# Altium schematic sheet OPA4377.SchDoc
size A2
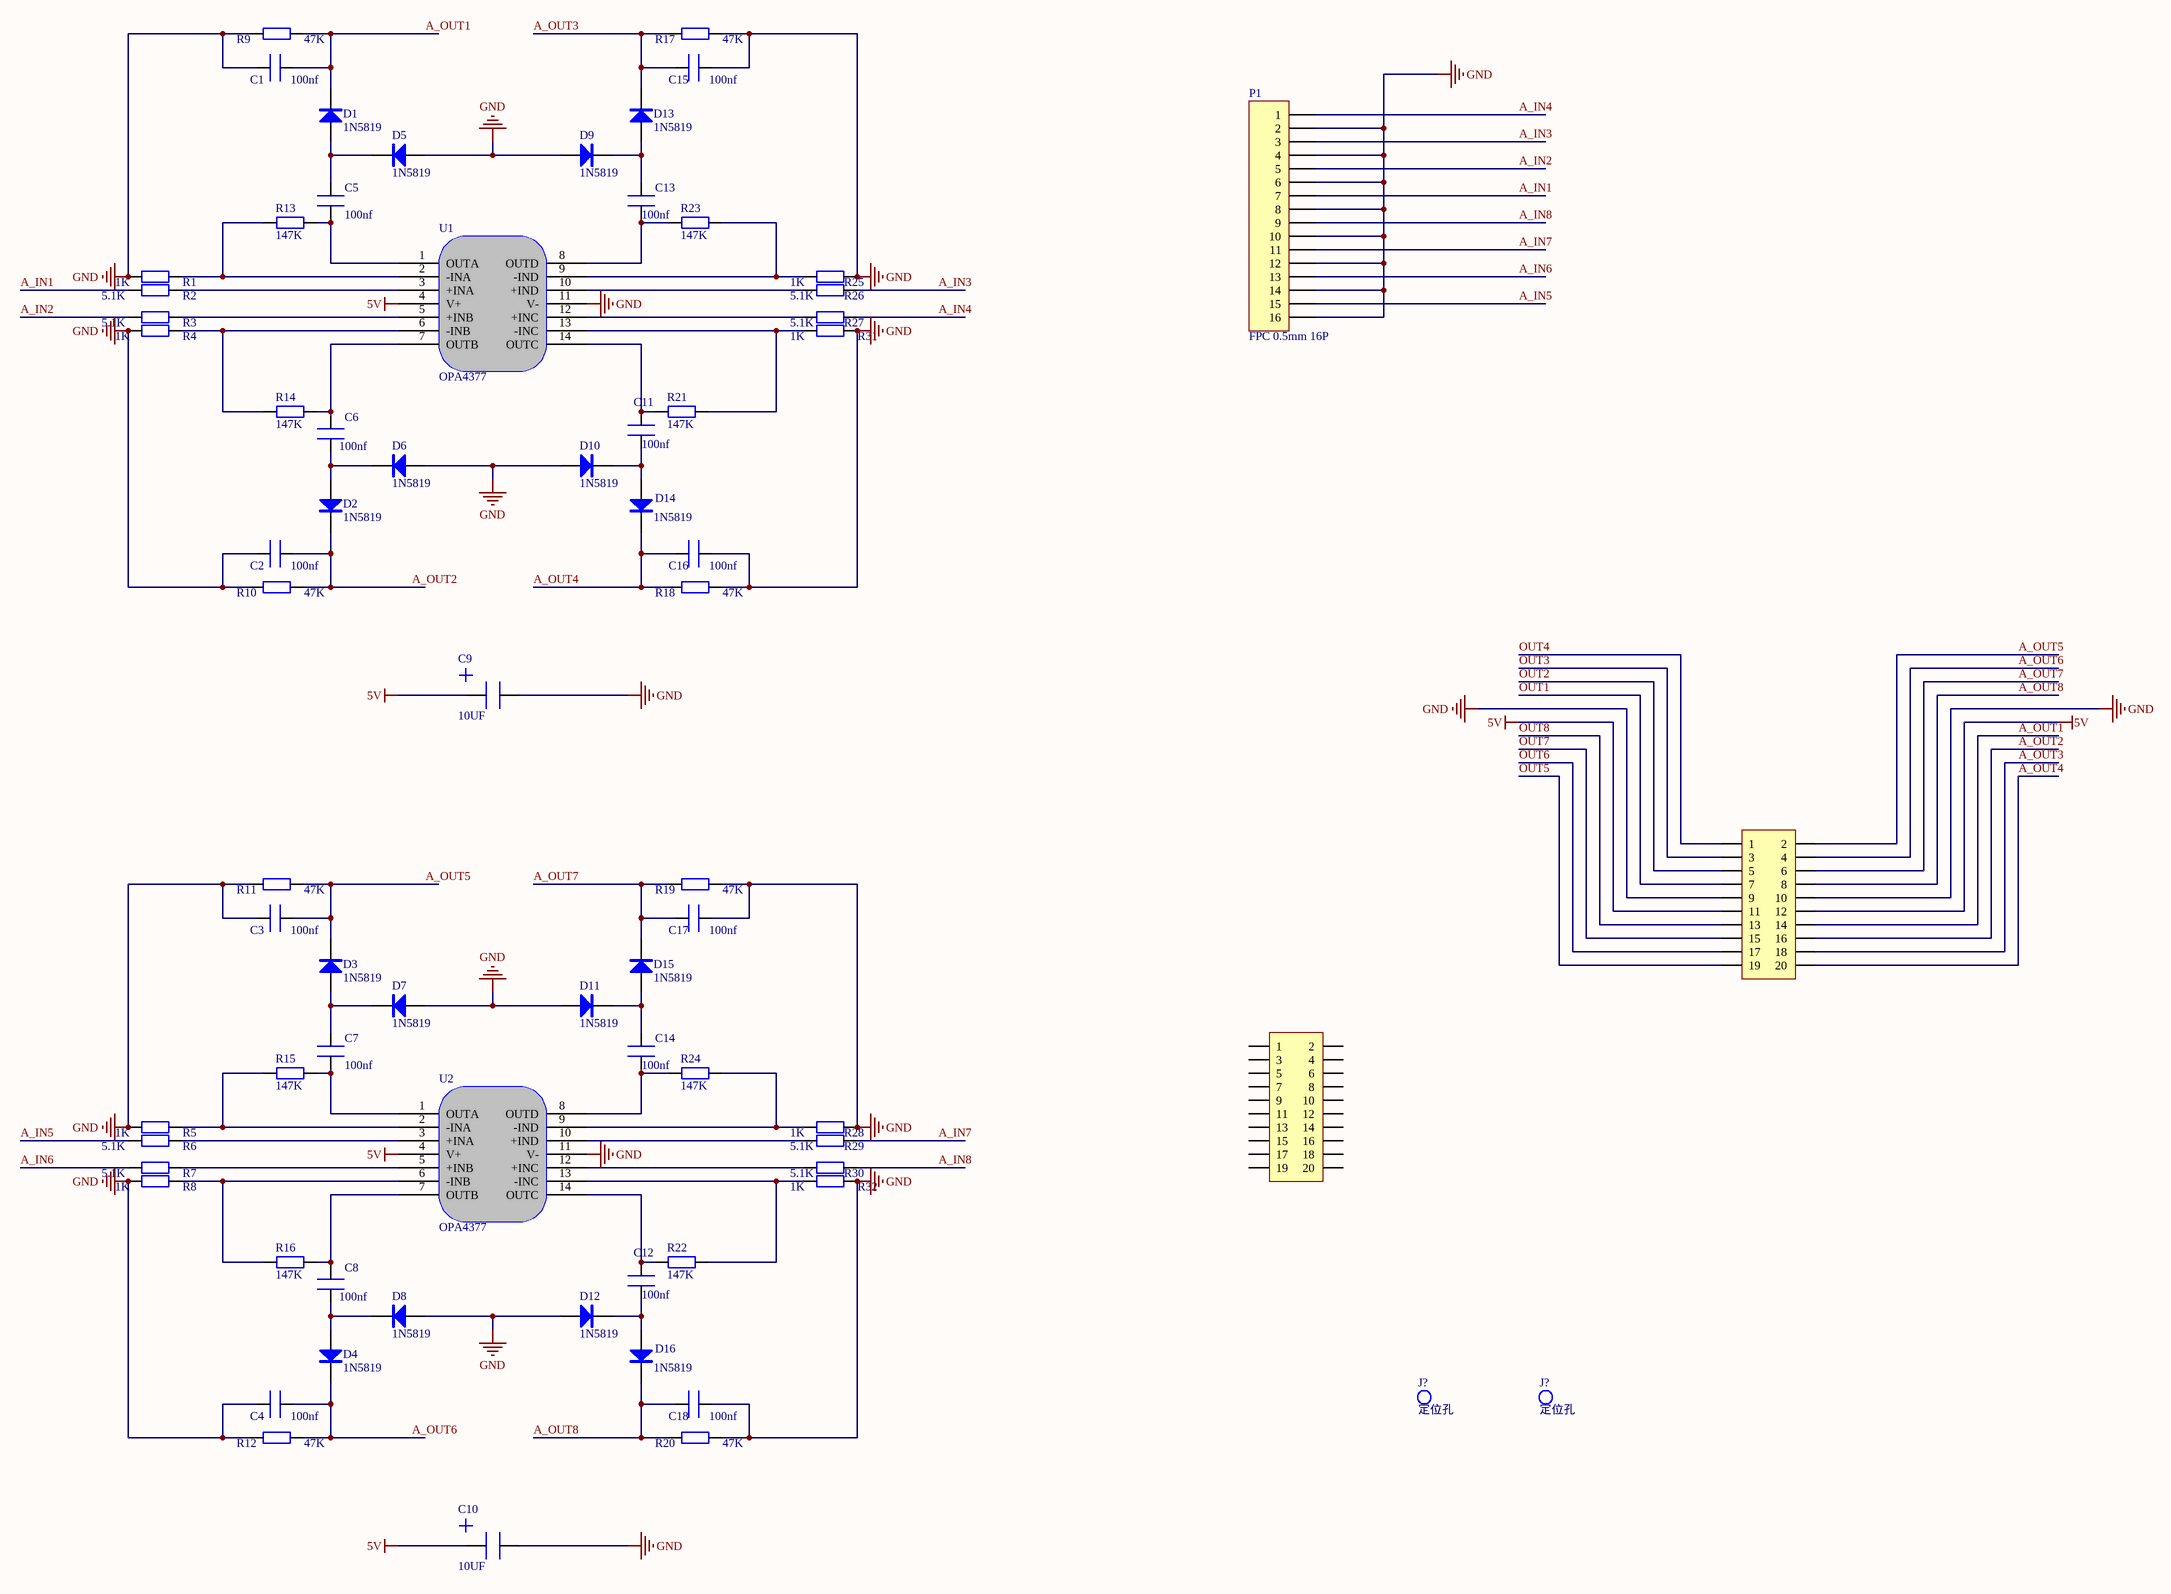
[diagram p0: OPA4377.SchDoc]

## Parts
(Parts that share a designator on the sheet are numbered #1, #2 ... from top to bottom, then left to right.)
C1  100nf  [C0603]
C2  100nf  [C0603]
C3  100nf  [C0603]
C4  100nf  [C0603]
C5  100nf  [C0603]
C6  100nf  [C0603]
C7  100nf  [C0603]
C8  100nf  [C0603]
C9  10UF  [0805 电容 C3]
C10  10UF  [0805 电容 C3]
C11  100nf  [C0603]
C12  100nf  [C0603]
C13  100nf  [C0603]
C14  100nf  [C0603]
C15  100nf  [C0603]
C16  100nf  [C0603]
C17  100nf  [C0603]
C18  100nf  [C0603]
D1  1N5819  [SOD-523]
D2  1N5819  [SOD-523]
D3  1N5819  [SOD-523]
D4  1N5819  [SOD-523]
D5  1N5819  [SOD-523]
D6  1N5819  [SOD-523]
D7  1N5819  [SOD-523]
D8  1N5819  [SOD-523]
D9  1N5819  [SOD-523]
D10  1N5819  [SOD-523]
D11  1N5819  [SOD-523]
D12  1N5819  [SOD-523]
D13  1N5819  [SOD-523]
D14  1N5819  [SOD-523]
D15  1N5819  [SOD-523]
D16  1N5819  [SOD-523]
J?#1  定位孔  [MTGP720H320V6P - duplicate]
J?#2  定位孔  [MTGP720H320V6P - duplicate]
JP?#1  Header 2X10  [HDR2.54-LI-2x10P]  (value not drawn)
JP?#2  Header 2X10  [HDR2.54-LI-2x10P]  (value not drawn)
P1  FPC 0.5mm 16P  [FPC0.5 2H-WS-16P]
R1  1K  [R0603]
R2  5.1K  [R0603]
R3  5.1K  [R0603]
R4  1K  [R0603]
R5  1K  [R0603]
R6  5.1K  [R0603]
R7  5.1K  [R0603]
R8  1K  [R0603]
R9  47K  [R0603]
R10  47K  [R0603]
R11  47K  [R0603]
R12  47K  [R0603]
R13  147K  [R0603]
R14  147K  [R0603]
R15  147K  [R0603]
R16  147K  [R0603]
R17  47K  [R0603]
R18  47K  [R0603]
R19  47K  [R0603]
R20  47K  [R0603]
R21  147K  [R0603]
R22  147K  [R0603]
R23  147K  [R0603]
R24  147K  [R0603]
R25  1K  [R0603]
R26  5.1K  [R0603]
R27  5.1K  [R0603]
R28  1K  [R0603]
R29  5.1K  [R0603]
R30  5.1K  [R0603]
R31  1K  [R0603]
R32  1K  [R0603]
U1  OPA4377  [TSSOP-14]
U2  OPA4377  [TSSOP-14]

## Nets
5V: C9.1 C10.1 JP?#1.11 JP?#1.12 U1.4(V+) U2.4(V+)
GND: C1.2 C2.2 C3.2 C4.2 C9.2 C10.2 C15.1 C16.1 C17.1 C18.1 D5.1(A) D6.1(A) D7.1(A) D8.1(A) D9.1(A) D10.1(A) D11.1(A) D12.1(A) JP?#1.9 JP?#1.10 P1.2 P1.4 P1.6 P1.8 P1.10 P1.12 P1.14 P1.16 R1.1 R4.1 R5.1 R8.1 R9.1 R10.1 R11.1 R12.1 R17.2 R18.2 R19.2 R20.2 R25.2 R28.2 R31.2 R32.2 U1.11(V-) U2.11(V-)
A_IN1: P1.7 R2.1
A_IN2: P1.5 R3.1
A_IN3: P1.3 R26.2
A_IN4: P1.1 R27.2
A_IN5: P1.15 R6.1
A_IN6: P1.13 R7.1
A_IN7: P1.11 R29.2
A_IN8: P1.9 R30.2
A_OUT1: C1.1 D1.2(K) JP?#1.14 R9.2
A_OUT2: C2.1 D2.2(K) JP?#1.16 R10.2
A_OUT3: C15.2 D13.2(K) JP?#1.18 R17.1
A_OUT4: C16.2 D14.2(K) JP?#1.20 R18.1
A_OUT5: C3.1 D3.2(K) JP?#1.2 R11.2
A_OUT6: C4.1 D4.2(K) JP?#1.4 R12.2
A_OUT7: C17.2 D15.2(K) JP?#1.6 R19.1
A_OUT8: C18.2 D16.2(K) JP?#1.8 R20.1
OUT1: JP?#1.7
OUT2: JP?#1.5
OUT3: JP?#1.3
OUT4: JP?#1.1
OUT5: JP?#1.19
OUT6: JP?#1.17
OUT7: JP?#1.15
OUT8: JP?#1.13
NetC5_1: C5.1 R13.2 U1.1(OUTA)
NetC5_2: C5.2 D1.1(A) D5.2(K)
NetC6_1: C6.1 R14.2 U1.7(OUTB)
NetC6_2: C6.2 D2.1(A) D6.2(K)
NetC7_1: C7.1 R15.2 U2.1(OUTA)
NetC7_2: C7.2 D3.1(A) D7.2(K)
NetC8_1: C8.1 R16.2 U2.7(OUTB)
NetC8_2: C8.2 D4.1(A) D8.2(K)
NetC11_1: C11.1 D10.2(K) D14.1(A)
NetC11_2: C11.2 R21.1 U1.14(OUTC)
NetC12_1: C12.1 D12.2(K) D16.1(A)
NetC12_2: C12.2 R22.1 U2.14(OUTC)
NetC13_1: C13.1 R23.1 U1.8(OUTD)
NetC13_2: C13.2 D9.2(K) D13.1(A)
NetC14_1: C14.1 R24.1 U2.8(OUTD)
NetC14_2: C14.2 D11.2(K) D15.1(A)
NetR1_2: R1.2 R13.1 U1.2(-INA)
NetR2_2: R2.2 U1.3(+INA)
NetR3_2: R3.2 U1.5(+INB)
NetR4_2: R4.2 R14.1 U1.6(-INB)
NetR5_2: R5.2 R15.1 U2.2(-INA)
NetR6_2: R6.2 U2.3(+INA)
NetR7_2: R7.2 U2.5(+INB)
NetR8_2: R8.2 R16.1 U2.6(-INB)
NetR21_2: R21.2 R31.1 U1.13(-INC)
NetR22_2: R22.2 R32.1 U2.13(-INC)
NetR23_2: R23.2 R25.1 U1.9(-IND)
NetR24_2: R24.2 R28.1 U2.9(-IND)
NetR26_1: R26.1 U1.10(+IND)
NetR27_1: R27.1 U1.12(+INC)
NetR29_1: R29.1 U2.10(+IND)
NetR30_1: R30.1 U2.12(+INC)

Not connected (* = marked no-connect by the designer): JP?#2 1 2 3 4 5 6 7 8 9 10 11 12 13 14 15 16 17 18 19 20

## Library data of the parts
C1-C8 C11-C18 = 100nf  0603 C
C9 C10 = TAN C
D1-D16 = 1N5819: 肖特基二极管; 淘宝ID: 黄晶宝石; 属性: 40V/2A; BOM名称: 肖特基二极管; 欢迎光临: https://shop463601444.taobao.com
JP?#1 JP?#2 = Header 10X2: 10*2P接插件; 版权归属: 源创客; BOM名称: 10*2P接插件; 学习资源: www.ooocke.com
P1 = Header 16: Header, 16-Pin; LatestRevisionDate: 17-Jul-2002; LatestRevisionNote: Re-released for DXP Platform.; Publisher: Altium Limited
R1 R4 R5 R8 R25 R28 R31 R32 = 1K 0603 R
R2 R3 R6 R7 R26 R27 R29 R30 = 5.1K 0603 R
R9-R24 = 47K 0603 R